# Altium schematic sheet SD卡 PHY.schdoc
size 297 x 209 mm; Symbol: Drawing-Symbol_A4; Company: 嘉立创EDA; Version: V1.0; Page Size: A4; @Project Name: RK3566; @Update Date: 2026-10-04; @Create Date: 2026-05-22; Device: Drawing-Symbol_A4; @Board Name: Board1; @Page Name: P2; @Create Time: 03:19:08; @Page Count: 7; @Page No: 7; @Schematic Name: Schematic1; @Update Time: 03:19:08; @Assembly Variant: Basic; Border: 1; Title Block Position: 3; Size: A4; Width: 1170; Height: 825; Region Start: 1; X Region Count: 6; Y Region Count: 4; Blade Width: 10; SheetNumber: 4; SheetTotal: 11
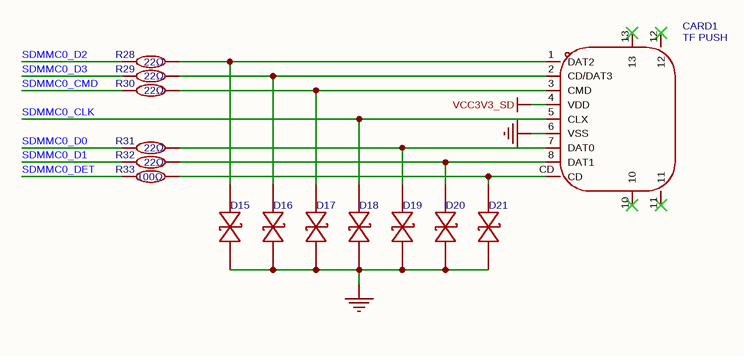
[diagram p0: SD卡 PHY.schdoc]

## Parts
CARD1  TF PUSH  [TF-SMD_TF-PUSH]
D15  BDFN1C051R  [DFN0603-D_L0.6-W0.3-P0.34-BI]  (value not drawn)
D16  BDFN1C051R  [DFN0603-D_L0.6-W0.3-P0.34-BI]  (value not drawn)
D17  BDFN1C051R  [DFN0603-D_L0.6-W0.3-P0.34-BI]  (value not drawn)
D18  BDFN1C051R  [DFN0603-D_L0.6-W0.3-P0.34-BI]  (value not drawn)
D19  BDFN1C051R  [DFN0603-D_L0.6-W0.3-P0.34-BI]  (value not drawn)
D20  BDFN1C051R  [DFN0603-D_L0.6-W0.3-P0.34-BI]  (value not drawn)
D21  BDFN1C051R  [DFN0603-D_L0.6-W0.3-P0.34-BI]  (value not drawn)
R28  22Ω  [R0402]
R29  22Ω  [R0402]
R30  22Ω  [R0402]
R31  22Ω  [R0402]
R32  22Ω  [R0402]
R33  100Ω  [R0402]

## Nets
GND: CARD1.6(VSS) D15.1 D16.1 D17.1 D18.1 D19.1 D20.1 D21.1
VCC3V3_SD: CARD1.4(VDD)
SDMMC0_CLK: CARD1.5(CLX) D18.2
SDMMC0_CMD: R30.1
SDMMC0_D0: R31.1
SDMMC0_D1: R32.1
SDMMC0_D2: R28.1
SDMMC0_D3: R29.1
SDMMC0_DET: R33.1
NetCARD1_1: CARD1.1(DAT2) D15.2 R28.2
NetCARD1_2: CARD1.2(CD/DAT3) D16.2 R29.2
NetCARD1_3: CARD1.3(CMD) D17.2 R30.2
NetCARD1_7: CARD1.7(DAT0) D19.2 R31.2
NetCARD1_8: CARD1.8(DAT1) D20.2 R32.2
NetCARD1_CD: CARD1.CD D21.2 R33.2

Not connected (* = marked no-connect by the designer): CARD1 10* 11* 12* 13*

## Notes on the sheet
- 创建日期
- 2026-10-04
- 原理图
- 板子
- Schematic1
- Board1
- 更新日期
- 图页
- P2
- 绘制
- 审阅
- RK3566
- 版本
- V1.0
- 尺寸
- A4
- 页    7    共    7
- 嘉立创EDA

## Library data of the parts
CARD1 = TF PUSH: 卡连接方式:自弹式;卡类型:MicroSD卡(TF卡);连接器类型:卡座;本体最大高度:2mm;工作温度:-25℃~+90℃;; Manufacturer: SHOU HAN(首韩); AddInBom: yes; ModelId: 2d6270e77c9a43c6bb0aca962ba811a2聨0819f05c4eef4c71ace90d822a990e87; ModelTransform: 635.826,598.424,0,0,0,0,0.002,-82.441,-23.622; Card Connection Mode: 自弹式; Connector Type: 卡座; Additional Card Detection Pins: 无; Symbol: TF PUSH; Device: TF PUSH; LCSC Part Name: 9P，自弹式TF卡座; SupplierPart: C393941; ManufacturerPart: TF PUSH; Supplier Footprint: SMD; JLCPCB Part Class: Extended Part; Datasheet: https://item.szlcsc.com/datasheet/TF%2520PUSH/372553.html; Supplier: LCSC; ConvertToPcb: yes; FootprintName: TF-SMD_TF-PUSH; ModelName: TF-SMD_TF-PUSH; Card Type: MicroSD卡(TF卡); Supplementary Features: -; Height Above Board: 2mm; Operating Temperature: -25℃~+90℃
D15-D21 = BDFN1C051R: 极性:双向;反向截止电压(Vrwm):5V;钳位电压:13V;峰值脉冲电流(Ipp):4A@8/20us;击穿电压(VBR):5.5V;; Manufacturer: BORN(伯恩半导体); AddInBom: yes; ModelId: 295ccb0e91f84fca9fcc42e8f031306b聨0819f05c4eef4c71ace90d822a990e87; ModelName: DFN0603-D_L0.6-W0.3--H0.3-P0.34-BI; ModelTransform: 24.0157,12.2047,0,0,0,0,0,0,0; Polarity: 双向; Reverse Stand-Off Voltage (Vrwm): 5V; Clamping Voltage: 13V; Voltage - Breakdown: 5.5V; Reverse Leakage Current (Ir): 100nA; Number of Channels: 单路; level of protection: IEC 61000-4-4；IEC 61000-4-5；IEC 61000-4-2; Type: ESD; Junction Capacitance: 0.2pF; Symbol: BDFN1C051R; Device: BDFN1C051R; LCSC Part Name: 双向ESD 5V截止 峰值脉冲电流：4A@8/20us; SupplierPart: C152032; ManufacturerPart: BDFN1C051R; Supplier Footprint: DFN0603-D; JLCPCB Part Class: Extended Part; Datasheet: https://item.szlcsc.com/datasheet/BDFN1C051R/163372.html; Supplier: LCSC; ConvertToPcb: yes; FootprintName: DFN0603-D_L0.6-W0.3-P0.34-BI; Peak Pulse Current (Ipp): 4A@8/20us
R28-R32 = RC0402FR-0722RL: 电阻类型:厚膜电阻;阻值:22Ω;精度:±1%;功率:62.5mW;工作电压:50V;温度系数:±100ppm/℃;; Manufacturer: YAGEO(国巨); 3D Model: 98c88bc2b9094f218f3a3e30a7012738聨0819f05c4eef4c71ace90d822a990e87; 3D Model Transform: 39.37,19.685,0,0,0,0,0,0,0; Tolerance: ±1%; Power(Watts): 62.5mW; Voltage-Supply(Max): 50V; AddInBom: yes; ModelName: R0402_L1.0-W0.5-H0.4; Symbol: RC0402FR-0722RL; Device: RC0402FR-0722RL; LCSC Part Name: 厚膜电阻 22Ω ±1% 62.5mW; Supplier Part: C114765; Manufacturer Part: RC0402FR-0722RL; Supplier Footprint: 0402; JLCPCB Part Class: Extended Part; Datasheet: https://item.szlcsc.com/datasheet/RC0402FR-0722RL/116009.html; Supplier: LCSC; Type: 厚膜电阻; Value: 22Ω; Temperature Coefficient: ±100ppm/℃; Operating Temperature: -55℃~+155℃; ConvertToPcb: yes; FootprintName: R0402
R33 = RC0402FR-07100RL: 电阻类型:厚膜电阻;阻值:100Ω;精度:±1%;功率:62.5mW;工作电压:50V;温度系数:±100ppm/℃;; Manufacturer: YAGEO(国巨); AddInBom: yes; ModelId: 98c88bc2b9094f218f3a3e30a7012738聨0819f05c4eef4c71ace90d822a990e87; ModelName: R0402_L1.0-W0.5-H0.4; ModelTransform: 39.37,19.685,0,0,0,0,0,0,0; Tolerance: ±1%; Power(Watts): 62.5mW; Voltage-Supply(Max): 50V; Symbol: RC0402FR-07100RL; Device: RC0402FR-07100RL; LCSC Part Name: 厚膜电阻 100Ω ±1% 62.5mW; SupplierPart: C106232; ManufacturerPart: RC0402FR-07100RL; Supplier Footprint: 0402; JLCPCB Part Class: Extended Part; Datasheet: https://item.szlcsc.com/datasheet/RC0402FR-07100RL/107447.html; Supplier: LCSC; ConvertToPcb: yes; FootprintName: R0402; Type: 厚膜电阻; Value: 100Ω; Temperature Coefficient: ±100ppm/℃; Operating Temperature: -55℃~+155℃